# Altium schematic sheet Test_Sensor_Connectoren.SchDoc
size A4; SheetNumber: 9; SheetTotal: 9
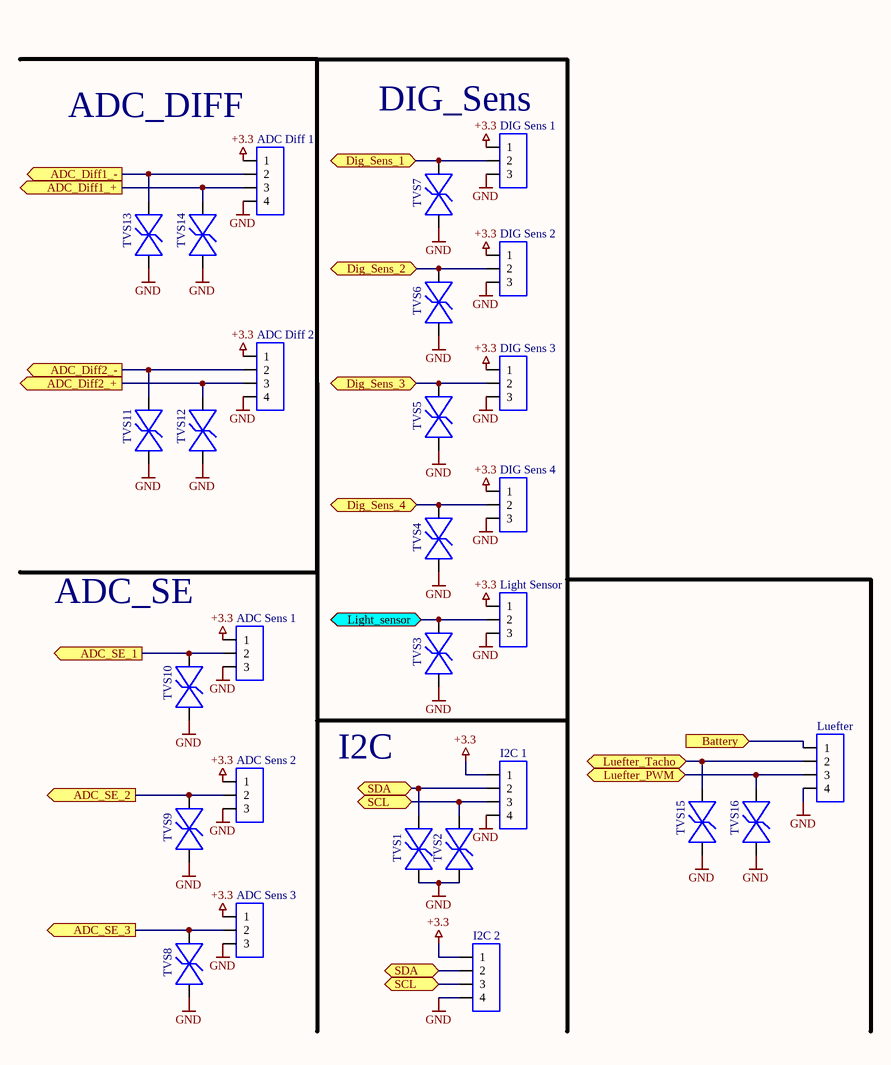
[diagram p0: Test_Sensor_Connectoren.SchDoc]

## Parts
ADC_Diff_1  JST-XH  [Sip-4]  (value not drawn)
ADC_Diff_2  JST-XH  [Sip-4]  (value not drawn)
ADC_Sens_1  JST-XH  [Sip-3]  (value not drawn)
ADC_Sens_2  JST-XH  [Sip-3]  (value not drawn)
ADC_Sens_3  JST-XH  [Sip-3]  (value not drawn)
DIG_Sens_1  JST-XH  [Sip-3]  (value not drawn)
DIG_Sens_2  JST-XH  [Sip-3]  (value not drawn)
DIG_Sens_3  JST-XH  [Sip-3]  (value not drawn)
DIG_Sens_4  JST-XH  [Sip-3]  (value not drawn)
I2C_1  JST-XH  [Sip-4]  (value not drawn)
I2C_2  JST-XH  [Sip-4]  (value not drawn)
Light_Sensor  JST-XH  [Sip-3]  (value not drawn)
Luefter  JST-XH  [Sip-4]  (value not drawn)
TVS1  DRTR5V0U1LPQ-7B  [X1-DFN1006-2_P6X1_DIO]  (value not drawn)
TVS2  DRTR5V0U1LPQ-7B  [X1-DFN1006-2_P6X1_DIO]  (value not drawn)
TVS3  DRTR5V0U1LPQ-7B  [X1-DFN1006-2_P6X1_DIO]  (value not drawn)
TVS4  DRTR5V0U1LPQ-7B  [X1-DFN1006-2_P6X1_DIO]  (value not drawn)
TVS5  DRTR5V0U1LPQ-7B  [X1-DFN1006-2_P6X1_DIO]  (value not drawn)
TVS6  DRTR5V0U1LPQ-7B  [X1-DFN1006-2_P6X1_DIO]  (value not drawn)
TVS7  DRTR5V0U1LPQ-7B  [X1-DFN1006-2_P6X1_DIO]  (value not drawn)
TVS8  DRTR5V0U1LPQ-7B  [X1-DFN1006-2_P6X1_DIO]  (value not drawn)
TVS9  DRTR5V0U1LPQ-7B  [X1-DFN1006-2_P6X1_DIO]  (value not drawn)
TVS10  DRTR5V0U1LPQ-7B  [X1-DFN1006-2_P6X1_DIO]  (value not drawn)
TVS11  DRTR5V0U1LPQ-7B  [X1-DFN1006-2_P6X1_DIO]  (value not drawn)
TVS12  DRTR5V0U1LPQ-7B  [X1-DFN1006-2_P6X1_DIO]  (value not drawn)
TVS13  DRTR5V0U1LPQ-7B  [X1-DFN1006-2_P6X1_DIO]  (value not drawn)
TVS14  DRTR5V0U1LPQ-7B  [X1-DFN1006-2_P6X1_DIO]  (value not drawn)
TVS15  DRTR5V0U1LPQ-7B  [X1-DFN1006-2_P6X1_DIO]  (value not drawn)
TVS16  DRTR5V0U1LPQ-7B  [X1-DFN1006-2_P6X1_DIO]  (value not drawn)

## Ports
ADC_Diff1_+ (out, see STM32[1C]), ADC_Diff1_- (out, see STM32[1C]), ADC_Diff2_+ (out, see STM32[2B]), ADC_Diff2_- (out, see STM32[2B]), ADC_SE_1 (out, see STM32[1B]), ADC_SE_2 (out, see STM32[1B]), ADC_SE_3 (out, see STM32[2B]), Battery (in, see 5V,_3V3,_6a,_Batt[1A], 5V,_3V3,_6a,_Batt[1B], 5V,_3V3,_6a,_Batt[2D], 6b,_6c[1A], 6b,_6c[1C]), Dig_Sens_1 (bidir, see Raspberry_PI5[2B]), Dig_Sens_2 (bidir, see Raspberry_PI5[2B]), Dig_Sens_3 (bidir, see Raspberry_PI5[2B]), Dig_Sens_4 (bidir, see Raspberry_PI5[2B]), Light_sensor (bidir, see Raspberry_PI5[3B]), Luefter_PWM (bidir, see Raspberry_PI5[3B]), Luefter_Tacho (bidir, see Raspberry_PI5[3B]), SCL (bidir, see BNO555[2C], ICM-20948[2C], PCA9685[2B], Raspberry_PI5[2B], Test_Sensor_Connectoren[1D]), SCL (bidir, see BNO555[2C], ICM-20948[2C], PCA9685[2B], Raspberry_PI5[2B], Test_Sensor_Connectoren[2D]), SDA (bidir, see BNO555[2C], ICM-20948[2B], PCA9685[2B], Raspberry_PI5[2B], Test_Sensor_Connectoren[1C]), SDA (bidir, see BNO555[2C], ICM-20948[2B], PCA9685[2B], Raspberry_PI5[2B], Test_Sensor_Connectoren[2D])

## Nets
+3.3: ADC_Diff_1.1 ADC_Diff_2.1 ADC_Sens_1.1 ADC_Sens_2.1 ADC_Sens_3.1 DIG_Sens_1.1 DIG_Sens_2.1 DIG_Sens_3.1 DIG_Sens_4.1 I2C_1.1 I2C_2.1 Light_Sensor.1
GND: ADC_Diff_1.4 ADC_Diff_2.4 ADC_Sens_1.3 ADC_Sens_2.3 ADC_Sens_3.3 DIG_Sens_1.3 DIG_Sens_2.3 DIG_Sens_3.3 DIG_Sens_4.3 I2C_1.4 I2C_2.4 Light_Sensor.3 Luefter.4 TVS1.1 TVS2.1 TVS3.1 TVS4.1 TVS5.1 TVS6.1 TVS7.1 TVS8.1 TVS9.1 TVS10.1 TVS11.1 TVS12.1 TVS13.1 TVS14.1 TVS15.1 TVS16.1
ADC_Diff1_+: ADC_Diff_1.3 TVS14.2 ; port ADC_Diff1_+
ADC_Diff1_-: ADC_Diff_1.2 TVS13.2 ; port ADC_Diff1_-
ADC_Diff2_+: ADC_Diff_2.3 TVS12.2 ; port ADC_Diff2_+
ADC_Diff2_-: ADC_Diff_2.2 TVS11.2 ; port ADC_Diff2_-
ADC_SE_1: ADC_Sens_1.2 TVS10.2 ; port ADC_SE_1
ADC_SE_2: ADC_Sens_2.2 TVS9.2 ; port ADC_SE_2
ADC_SE_3: ADC_Sens_3.2 TVS8.2 ; port ADC_SE_3
Battery: Luefter.1 ; port Battery
Dig_Sens_1: DIG_Sens_1.2 TVS7.2 ; port Dig_Sens_1
Dig_Sens_2: DIG_Sens_2.2 TVS6.2 ; port Dig_Sens_2
Dig_Sens_3: DIG_Sens_3.2 TVS5.2 ; port Dig_Sens_3
Dig_Sens_4: DIG_Sens_4.2 TVS4.2 ; port Dig_Sens_4
Light_sensor: Light_Sensor.2 TVS3.2 ; port Light_sensor
Luefter_PWM: Luefter.3 TVS16.2 ; port Luefter_PWM
Luefter_Tacho: Luefter.2 TVS15.2 ; port Luefter_Tacho
SCL: I2C_1.3 I2C_2.3 TVS2.2 ; port SCL
SDA: I2C_1.2 I2C_2.2 TVS1.2 ; port SDA

## Notes on the sheet
- ADC_DIFF
- (near DIG_Sens_1) DIG_Sens
- ADC_SE
- I2C

## Library data of the parts
ADC_Diff_1 ADC_Diff_2 I2C_1 I2C_2 Luefter = CON4
ADC_Sens_1-ADC_Sens_3 DIG_Sens_1-DIG_Sens_4 Light_Sensor = CON3
TVS1-TVS16 = DRTR5V0U1LPQ-7B: TVS Diode; Manufacturer_Name: Diodes Inc; Copyright: Copyright (C) 2025 Ultra Librarian. All rights reserved.; Manufacturer_Part_Number: DRTR5V0U1LPQ-7B; RefDes: RefDes; Type: Type